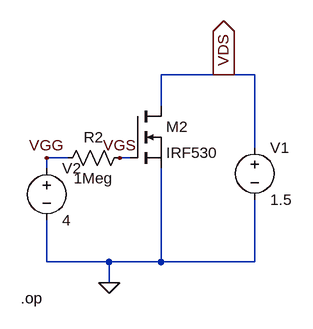
[diagram p0: schematic MOSFET_DC.asc]
MOSFET_DC.asc, the LTspice schematic file:
Version 4.1
SHEET 1 880 680
WIRE 384 160 288 160
WIRE 432 160 384 160
WIRE 288 208 288 160
WIRE 432 272 432 160
WIRE 144 288 112 288
WIRE 240 288 224 288
WIRE 112 304 112 288
WIRE 112 448 112 384
WIRE 208 448 112 448
WIRE 288 448 288 304
WIRE 288 448 208 448
WIRE 432 448 432 352
WIRE 432 448 288 448
WIRE 208 480 208 448
FLAG 208 480 0
FLAG 112 288 VGG
FLAG 224 288 VGS
FLAG 384 160 VDS
IOPIN 384 160 Out
SYMBOL nmos 240 208 R0
SYMATTR InstName M2
SYMATTR Value IRF530
SYMBOL voltage 432 256 R0
WINDOW 123 0 0 Left 0
WINDOW 39 0 0 Left 0
SYMATTR InstName V1
SYMATTR Value 1.5
SYMBOL voltage 112 288 R0
WINDOW 123 0 0 Left 0
WINDOW 39 0 0 Left 0
SYMATTR InstName V2
SYMATTR Value 4
SYMBOL res 240 272 R90
WINDOW 0 0 56 VBottom 2
WINDOW 3 32 56 VTop 2
SYMATTR InstName R2
SYMATTR Value 1Meg
TEXT 72 504 Left 2 !.op

The netlist it stands for:
* MOSFET_DC.asc
M2 VDS VGS 0 0 IRF530
V1 VDS 0 1.5
V2 VGG 0 4
R2 VGS VGG 1Meg
.model NMOS NMOS
.model PMOS PMOS
.lib standard.mos
.op
.backanno
.end